# Altium project IMU Product.PrjPcb (part 1 of 2)
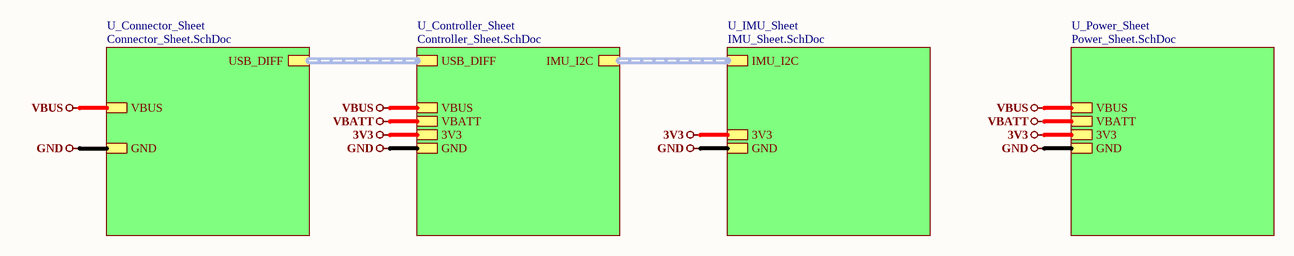
[diagram p0: Top-Sheet.SchDoc]
5 sheets, 58 parts. Net scope: hierarchical (ports join the sheet entries above them; power ports are global).
Board file: IMU Product.PcbDoc
Sheets:
  Top-Sheet.SchDoc
    U_Connector_Sheet = Connector_Sheet.SchDoc
    U_Controller_Sheet = Controller_Sheet.SchDoc
    U_IMU_Sheet = IMU_Sheet.SchDoc
    U_Power_Sheet = Power_Sheet.SchDoc

## Sheet Top-Sheet.SchDoc
size A4; SheetNumber: 1; SheetTotal: 5

### Sub-sheets
U_Connector_Sheet = Connector_Sheet.SchDoc: USB_DIFF (harness USB_DIFF), VBUS, GND
U_Controller_Sheet = Controller_Sheet.SchDoc: USB_DIFF (harness USB_DIFF), IMU_I2C (harness IMU_I2C), VBUS, VBATT, 3V3, GND
U_IMU_Sheet = IMU_Sheet.SchDoc: IMU_I2C (harness IMU_I2C), 3V3, GND
U_Power_Sheet = Power_Sheet.SchDoc: VBUS, VBATT, 3V3, GND

### Nets
3V3: sheet U_Controller_Sheet/3V3, sheet U_IMU_Sheet/3V3, sheet U_Power_Sheet/3V3
GND: sheet U_Connector_Sheet/GND, sheet U_Controller_Sheet/GND, sheet U_IMU_Sheet/GND, sheet U_Power_Sheet/GND
VBATT: sheet U_Controller_Sheet/VBATT, sheet U_Power_Sheet/VBATT
VBUS: sheet U_Connector_Sheet/VBUS, sheet U_Controller_Sheet/VBUS, sheet U_Power_Sheet/VBUS

### Buses and harness runs
harness sheet U_Connector_Sheet/USB_DIFF = sheet U_Controller_Sheet/USB_DIFF
harness sheet U_Controller_Sheet/IMU_I2C = sheet U_IMU_Sheet/IMU_I2C

### Notes on the sheet
- File:
- Title:
- Date:
- Page
- Num:
- Total:
- Drawn By: Huzaifa Ali

## Sheet Connector_Sheet.SchDoc
size A4; SheetNumber: 4; SheetTotal: 5
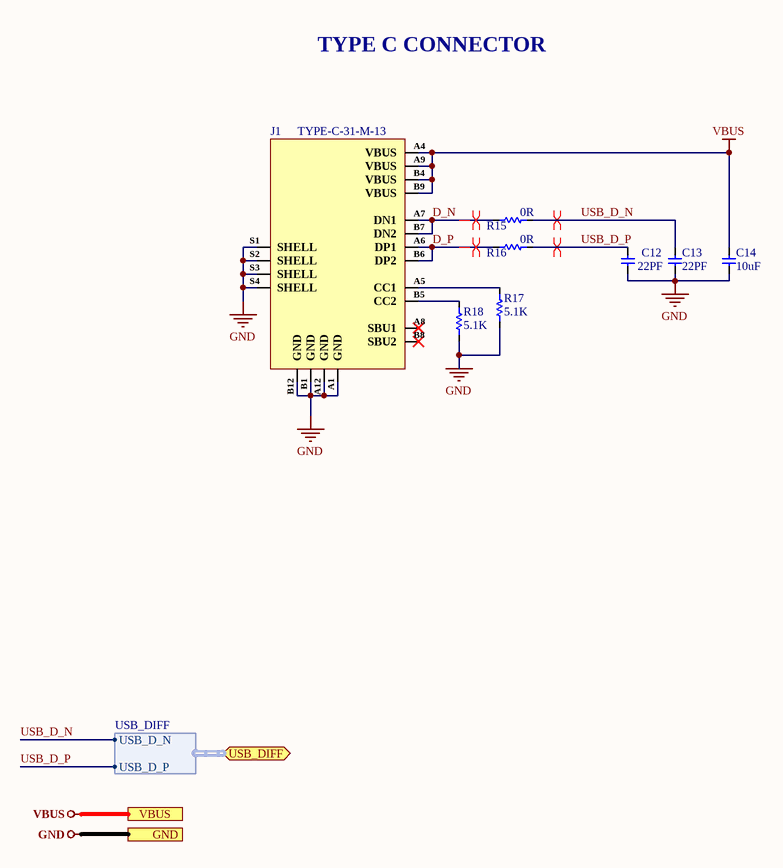
[diagram p1: Connector_Sheet.SchDoc]

### Parts
C12  22PF  [Cap-0402]
C13  22PF  [Cap-0402]
C14  10uF  [Cap-0402]
J1  TYPE-C-31-M-13  [TYPE-C-31-M-13]
R15  0R  [Res-0402]
R16  0R  [Res-0402]
R17  5.1K  [Res-0402]
R18  5.1K  [Res-0402]

### Ports
GND, USB_DIFF (bidir, harness USB_DIFF), VBUS

### Harnesses
USB_DIFF: USB_D_N, USB_D_P

### Nets
GND: C12.1 C13.1 C14.1 J1.A1(GND) J1.A12(GND) J1.B1(GND) J1.B12(GND) J1.S1(SHELL) J1.S2(SHELL) J1.S3(SHELL) J1.S4(SHELL) R17.1 R18.1 ; port GND
VBUS: C14.2 J1.A4(VBUS) J1.A9(VBUS) J1.B4(VBUS) J1.B9(VBUS) ; port VBUS
D_N: J1.A7(DN1) J1.B7(DN2) R15.1
D_P: J1.A6(DP1) J1.B6(DP2) R16.1
USB_D_N: C13.2 R15.2 ; port USB_DIFF.USB_D_N
USB_D_P: C12.2 R16.2 ; port USB_DIFF.USB_D_P
NetJ1_A5: J1.A5(CC1) R17.2
NetJ1_B5: J1.B5(CC2) R18.2

Not connected (* = marked no-connect by the designer): J1 A8(SBU1)* B8(SBU2)*

### Layout directives
differential pair; net class USB_PROGRAM; differential pair class USB_PROGRAM_LINES; rule Impedance Constraint [Min = 85.00    Max = 90.00    ]; rule Matched Net Lengths [Tolerance = 50mil]: D_N, D_P, USB_D_N, USB_D_P

### Notes on the sheet
- TYPE C CONNECTOR
- File:
- Title:
- Date:
- Page
- Num:
- Total:
- Drawn By: Huzaifa Ali

### Library data of the parts
C12 C13 = CC0402JRNPO9BN220: CAP CER 22PF 50V C0G/NPO 0402; Manufacturer: Yageo; Dielectric Material: Ceramic; Tolerance: 5%; Dielectric: C0G; Temperature Coefficient: 30ppm/°C; Insulation Resistance: 100GR; Item Type: Capacitor; Supplier 1: Future Electronics; Manufacturer Part Number: CC0402JRNPO9BN220; RoHS: Yes; Category: Ceramic Capacitors; Stock 1: 200000; Pricing 1: 10000=0.00220, 40000=0.00210, 150000=0.00200, 400000=0.00190, 1000000=0.00180 (USD); Mounting Technology: Surface Mount; Case/Package: 0402; Pins: 2; Case Code (Metric): 1005; Case Code (Imperial): 0402; Min Operating Temperature: -55°C; Max Operating Temperature: 125°C; Value: 22pF; Voltage Rating: 50V; Packaging: Tape and Reel; Package Quantity: 1; Voltage Rating (DC): 50V; Termination: SMD/SMT; Resistor Type: Ceramic; Voltage: 50V; Series: CC; Length: 1mm; Width: 0.02inch; Height: 0.5mm; Thickness: 0.022inch; Depth: 0.5mm; Radiation Hardening: No; Reach SVHC Compliant: Yes; Lead Free: Lead Free; RoHS Compliant: Yes; ComponentLink1URL: https://datasheet.ciiva.com/5789/1443161-5789509.pdf?src-supplier=Farnell; ComponentLink1Description: https://datasheet.ciiva.com/5789/1443161-5789509.pdf?src-supplier=Farnell; ComponentLink2URL: https://datasheet.ciiva.com/8033/1443161-8033606.pdf?src-supplier=Element14; ComponentLink2Description: https://datasheet.ciiva.com/8033/1443161-8033606.pdf?src-supplier=Element14; ComponentLink3URL: https://datasheet.ciiva.com/7656/1132289-7656615.pdf?src-supplier=Element14; ComponentLink3Description: https://datasheet.ciiva.com/7656/1132289-7656615.pdf?src-supplier=Element14; ComponentLink4URL: https://datasheet.ciiva.com/8033/1443161-8033607.pdf?src-supplier=Element14; ComponentLink4Description: https://datasheet.ciiva.com/8033/1443161-8033607.pdf?src-supplier=Element14; ComponentLink5URL: https://datasheet.ciiva.com/8033/1443161-8033605.pdf?src-supplier=Element14; ComponentLink5Description: https://datasheet.ciiva.com/8033/1443161-8033605.pdf?src-supplier=Element14; ComponentLink6URL: https://datasheet.ciiva.com/143/mlccorderingcode-143987.pdf?src-supplier=Digi-Key; ComponentLink6Description: https://datasheet.ciiva.com/143/mlccorderingcode-143987.pdf?src-supplier=Digi-Key; ComponentLink7URL: https://datasheet.ciiva.com/143/mlccorderingcode-143986.pdf?src-supplier=Digi-Key; ComponentLink7Description: https://datasheet.ciiva.com/143/mlccorderingcode-143986.pdf?src-supplier=Digi-Key; ComponentLink8URL: https://datasheet.ciiva.com/143/mlccorderingcode-143988.pdf?src-supplier=Digi-Key; ComponentLink8Description: https://datasheet.ciiva.com/143/mlccorderingcode-143988.pdf?src-supplier=Digi-Key; ComponentLink9URL: https://datasheet.ciiva.com/5425/upy-gp-np0-16v-to-50v-8-5425483.pdf?src-supplier=Mouser; ComponentLink9Description: https://datasheet.ciiva.com/5425/upy-gp-np0-16v-to-50v-8-5425483.pdf?src-supplier=Mouser; ComponentLink10URL: https://datasheet.ciiva.com/15189/getdatasheetpartid-370074-15189117.pdf?src-supplier=Verical; ComponentLink10Description: https://datasheet.ciiva.com/15189/getdatasheetpartid-370074-15189117.pdf?src-supplier=Verical; Supplier Part Number 1: 9105957; LCSC Part Number: C106203
C14 = CL05A106MP5NUNC: CAP CER 10UF 10V X5R 0402; Manufacturer: Samsung; Tolerance: 20%; Item Type: Capacitor; Supplier 1: Avnet; Manufacturer Part Number: CL05A106MP5NUNC; RoHS: Yes; Category: Ceramic Capacitors; Stock 1: 1729850; Pricing 1: 10000=0.02537 (USD); Mount: Surface Mount; Case/Package: 0402; Case Code (Metric): 1005; Case Code (Imperial): 0402; Contact Plating: Tin; Min Operating Temperature: -55°C; Max Operating Temperature: 85°C; Package Quantity: 1; Packaging: Tape and Reel; Capacitance: 10uF; Voltage Rating: 10V; Dielectric: X5R; Termination: Wraparound; Series: CL; Construction: Flat; Length: 1mm; Width: 0.02inch; Thickness: 0.028inch; Depth: 0.5mm; Radiation Hardening: No; Lead Free: Lead Free; RoHS Compliant: Yes; ComponentLink1URL: https://datasheet.ciiva.com/25721/cl05a106mp5nunc-25721584.pdf?src-supplier=Digi-Key; ComponentLink1Description: https://datasheet.ciiva.com/25721/cl05a106mp5nunc-25721584.pdf?src-supplier=Digi-Key; ComponentLink2URL: https://datasheet.ciiva.com/26838/getdatasheetpartid-745310-26838170.pdf?src-supplier=Verical; ComponentLink2Description: https://datasheet.ciiva.com/26838/getdatasheetpartid-745310-26838170.pdf?src-supplier=Verical; Supplier Part Number 1: CL05A106MP5NUNC; LCSC Part Number: C315248
J1 = TYPE-C-31-M-13: 1 12P Female Type-C SMD USB Connectors ROHS; Manufacturer: Korean Hroparts Elec; Item Type: USB Type-C  Connector; Manufacturer Part Number: TYPE-C-31-M-13; Package: SMD; LCSC Part Number: C223906; ComponentLink1Description: LCSC; ComponentLink1URL: https://www.lcsc.com/product-detail/USB-Connectors_Korean-Hroparts-Elec-TYPE-C-31-M-13_C223906.html?s_z=n_TYPE-C-31-M-13
R15 R16 = RCS04020000Z0ED: RES SMD 0 OHM JUMPER 1/5W 0402; Manufacturer: Vishay Dale; Resistance: 0mR; Max Power Dissipation: 200mW; Item Type: Resistor; Supplier 1: Digi-Key; Manufacturer Part Number: RCS04020000Z0ED; Stock 1: 35470; Pricing 1: 1=0.1, 10=0.083, 25=0.0576, 50=0.0448, 100=0.032, 250=0.02496, 500=0.01984, 1000=0.01408, 5000=0.01088 (USD); Case/Package: 0402; Case Code (Metric): 1005; Case Code (Imperial): 0402; Min Operating Temperature: -55°C; Max Operating Temperature: 155°C; Packaging: Tape and Reel; Resistor Type: Thick Film; Number of Terminations: 2; Features: Automotive AEC-Q200; Length: 0.039inch; Width: 0.02inch; Height: 0.016inch; RoHS Compliant: Yes; ComponentLink1URL: http://www.farnell.com/datasheets/2618474.pdf?src-supplier=Farnell; ComponentLink1Description: http://www.farnell.com/datasheets/2618474.pdf?src-supplier=Farnell; ComponentLink2URL: http://www.farnell.com/datasheets/2618474.pdf?src-supplier=Element14; ComponentLink2Description: http://www.farnell.com/datasheets/2618474.pdf?src-supplier=Element14; ComponentLink3URL: http://www.vishay.com/docs/20065/rcse3.pdf?src-supplier=Digi-Key; ComponentLink3Description: http://www.vishay.com/docs/20065/rcse3.pdf?src-supplier=Digi-Key; ComponentLink4URL: http://www.farnell.com/datasheets/2618474.pdf?src-supplier=Newark; ComponentLink4Description: http://www.farnell.com/datasheets/2618474.pdf?src-supplier=Newark; Supplier Part Number 1: 541-2877-1-ND; LCSC Part Number: C844673
R17 R18 = RC0402FR-075K1L: RES 5.1K OHM 1% 1/16W 0402; Manufacturer: Yageo; Power Rating: 63mW; Resistance: 5.1kR; Temperature Coefficient: 100ppm/°C; Voltage Rating: 50V; Item Type: Resistor; Supplier 1: Avnet; Manufacturer Part Number: RC0402FR-075K1L; RoHS: Yes; Category: Chip SMD Resistors; Stock 1: 65000; Pricing 1: 10000=0.00085 (USD); Case/Package: 0402; Case Code (Metric): 1005; Case Code (Imperial): 0402; Min Operating Temperature: -55°C; Max Operating Temperature: 155°C; Tolerance: 1%; Technology: THICK FILM; Packaging: Tape and Reel; Package Quantity: 1; Resistor Type: Thick Film; Number of Terminations: 2; Termination: SMD/SMT; Max Power Dissipation: 63mW; Voltage Rating (DC): 50V; Working Voltage: 50V; Features: Moisture Resistant; Series: RC; Resistance Tolerance: 1%; Construction: Rectangular; Length: 1mm; Width: 0.02inch; Height: 0.016inch; Depth: 0.5mm; RoHS Compliant: Yes; Military Standard: Not; Lead Free: Lead Free; ComponentLink1URL: https://datasheet.ciiva.com/7983/1018594-7983519.pdf?src-supplier=Element14; ComponentLink1Description: https://datasheet.ciiva.com/7983/1018594-7983519.pdf?src-supplier=Element14; ComponentLink2URL: https://datasheet.ciiva.com/46394/1018594-46394936.pdf?src-supplier=Element14; ComponentLink2Description: https://datasheet.ciiva.com/46394/1018594-46394936.pdf?src-supplier=Element14; ComponentLink3URL: https://datasheet.ciiva.com/2453/pyu-r-int-thick-7-2453401.pdf?src-supplier=Digi-Key; ComponentLink3Description: https://datasheet.ciiva.com/2453/pyu-r-int-thick-7-2453401.pdf?src-supplier=Digi-Key; ComponentLink4URL: https://datasheet.ciiva.com/2453/pyu-r-int-thick-7-2453402.pdf?src-supplier=Digi-Key; ComponentLink4Description: https://datasheet.ciiva.com/2453/pyu-r-int-thick-7-2453402.pdf?src-supplier=Digi-Key; ComponentLink5URL: https://datasheet.ciiva.com/2453/pyu-r-int-thick-7-2453400.pdf?src-supplier=Digi-Key; ComponentLink5Description: https://datasheet.ciiva.com/2453/pyu-r-int-thick-7-2453400.pdf?src-supplier=Digi-Key; ComponentLink6URL: https://datasheet.ciiva.com/12558/pyu-rc0402-51-rohs-l-6-r-8721-12558460.pdf?src-supplier=Mouser; ComponentLink6Description: https://datasheet.ciiva.com/12558/pyu-rc0402-51-rohs-l-6-r-8721-12558460.pdf?src-supplier=Mouser; ComponentLink7URL: https://datasheet.ciiva.com/16744/pyu-rc0402-51-rohs-l-6-r-16744283.pdf?src-supplier=Future+Electronics; ComponentLink7Description: https://datasheet.ciiva.com/16744/pyu-rc0402-51-rohs-l-6-r-16744283.pdf?src-supplier=Future+Electronics; ComponentLink8URL: https://datasheet.ciiva.com/15189/getdatasheetpartid-323636-15189493.pdf?src-supplier=Verical; ComponentLink8Description: https://datasheet.ciiva.com/15189/getdatasheetpartid-323636-15189493.pdf?src-supplier=Verical; Supplier Part Number 1: RC0402FR-075K1L; LCSC Part Number: C105872

## Sheet Controller_Sheet.SchDoc
size A4; SheetNumber: 3; SheetTotal: 5
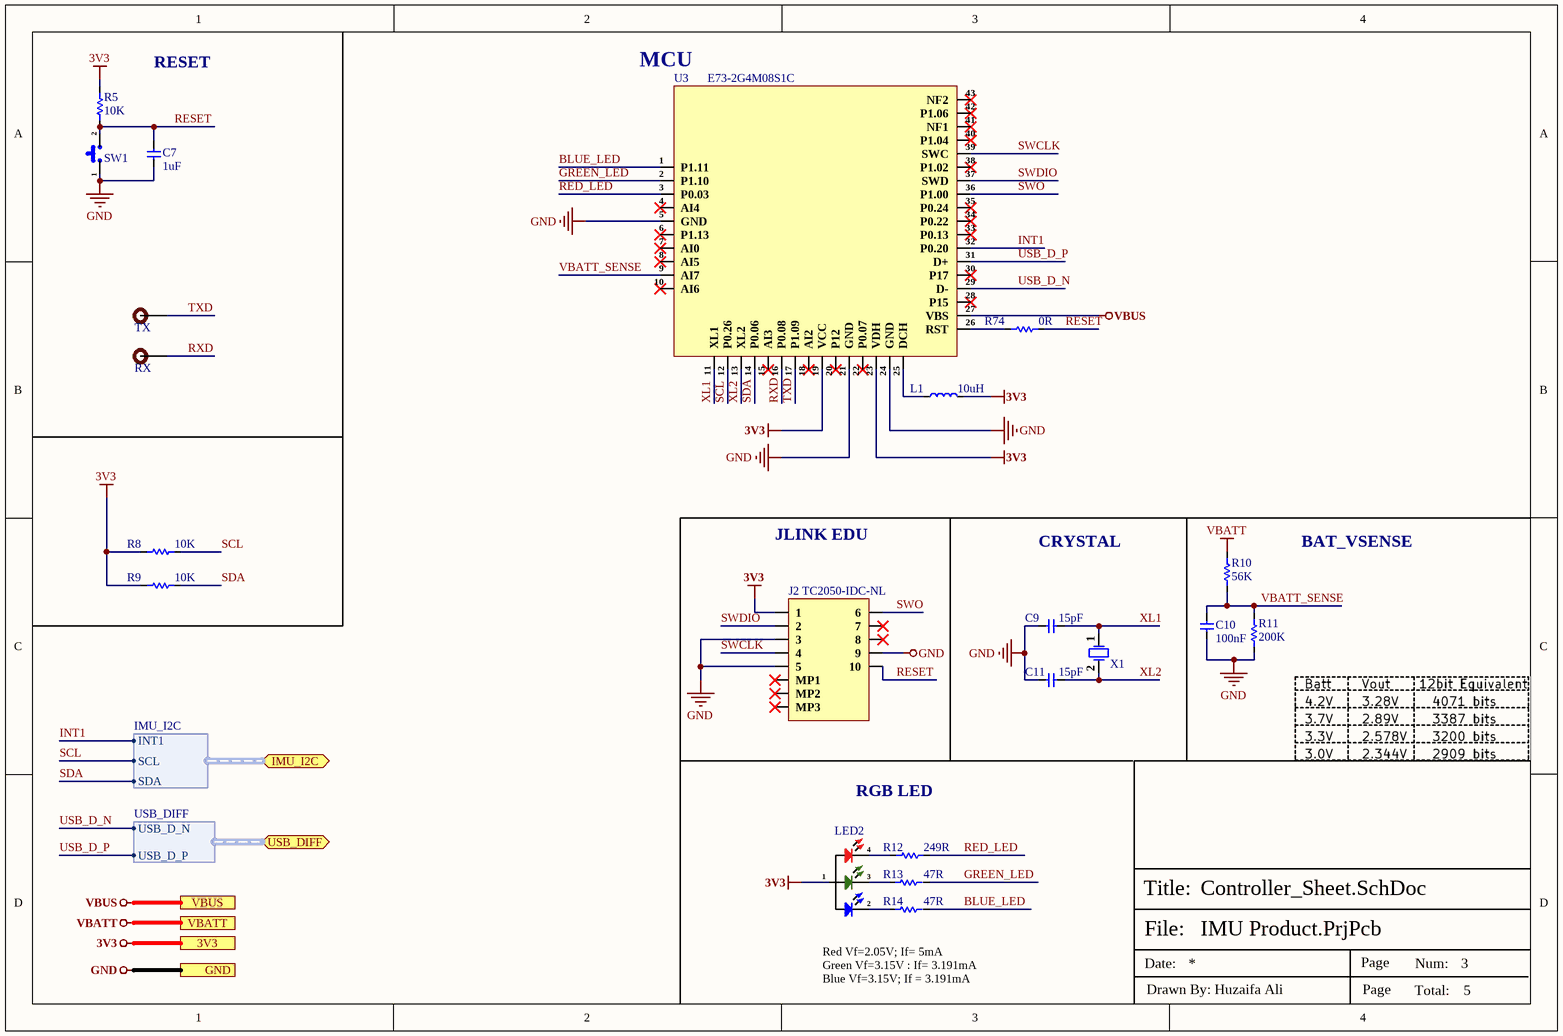
[diagram p2: Controller_Sheet.SchDoc]

### Parts
C7  1uF  [Cap-0402]
C9  15pF  [Cap-0402]
C10  100nF  [Cap-0402]
C11  15pF  [Cap-0402]
J2  TC2050-IDC-NL  [TC2050-IDC-NL_]
L1  10uH  [IND-0603 (1608 Metric)]
LED2  MHS110FRGBCT  [MHS110FRGBCT]  (value not drawn)
R5  10K  [Res-0402]
R8  10K  [Res-0402]
R9  10K  [Res-0402]
R10  56K  [Res-0402]
R11  200K  [Res-0402]
R12  249R  [Res-0402]
R13  47R  [Res-0402]
R14  47R  [Res-0402]
R74  0R  [Res-0402]
RX  TEST POINT 0.5mm Dia  [Test-point - 0.5mm]  (value not drawn)  (no BOM)
SW1  TS-1088-AR02016  [TS-1088-AR02016]  (value not drawn)
TX  TEST POINT 0.5mm Dia  [Test-point - 0.5mm]  (value not drawn)  (no BOM)
U3  E73-2G4M08S1C  [E73-2G4M08S1C]
X1  Q13FC13500004  [SMD3215-2P]  (value not drawn)

### Ports
3V3, GND, IMU_I2C (bidir, harness IMU_I2C), USB_DIFF (bidir, harness USB_DIFF), VBATT, VBUS

### Harnesses
USB_DIFF: USB_D_N, USB_D_P
IMU_I2C: INT1, SCL, SDA

### Nets
3V3: J2.1 L1.2 LED2.1(+) R5.2 R8.2 R9.2 U3.19(VCC) U3.23(VDH) ; port 3V3
GND: C7.1 C9.1 C10.1 C11.1 J2.3 J2.5 J2.9 R11.1 SW1.1 U3.5(GND) U3.21(GND) U3.24(GND) ; port GND
VBATT: R10.2 ; port VBATT
VBUS: U3.27(VBS) ; port VBUS
BLUE_LED: R14.2 U3.1(P1.11)
GREEN_LED: R13.2 U3.2(P1.10)
INT1: U3.32(P0.20) ; port IMU_I2C.INT1
RED_LED: R12.2 U3.3(P0.03)
RESET: C7.2 J2.10 R5.1 R74.2 SW1.2
RXD: RX.1 U3.16(P0.08)
SCL: R8.1 U3.12(P0.26) ; port IMU_I2C.SCL
SDA: R9.1 U3.14(P0.06) ; port IMU_I2C.SDA
SWCLK: J2.4 U3.39(SWC)
SWDIO: J2.2 U3.37(SWD)
SWO: J2.6 U3.36(P1.00)
TXD: TX.1 U3.17(P1.09)
USB_D_N: U3.29(D-) ; port USB_DIFF.USB_D_N
USB_D_P: U3.31(D+) ; port USB_DIFF.USB_D_P
VBATT_SENSE: C10.2 R10.1 R11.2 U3.9(AI7)
XL1: C9.2 U3.11(XL1) X1.1(OSC1)
XL2: C11.2 U3.13(XL2) X1.2(OSC2)
NetL1_1: L1.1 U3.25(DCH)
NetLED2_2: LED2.2(-BLUE) R14.1
NetLED2_3: LED2.3(-GREEN) R13.1
NetLED2_4: LED2.4(-RED) R12.1
NetR74_1: R74.1 U3.26(RST)

Not connected (* = marked no-connect by the designer): J2 7* 8* MP1* MP2* MP3*; U3 4(AI4)* 6(P1.13)* 7(AI0)* 8(AI5)* 10(AI6)* 15(AI3)* 18(AI2)* 20(P12)* 22(P0.07)* 28(P15)* 30(P17)* 33(P0.13)* 34(P0.22)* 35(P0.24)* 38(P1.02)* 40(P1.04)* 41(NF1)* 42(P1.06)* 43(NF2)*

### Notes on the sheet
- RESET
- (near U3) MCU
- JLINK EDU
- CRYSTAL
- BAT_VSENSE
- RGB LED
- Red Vf=2.05V; If= 5mA
  Green Vf=3.15V : If= 3.191mA
  Blue Vf=3.15V; If = 3.191mA
- File:
- Title:
- Date:
- Page
- Num:
- Total:
- Drawn By: Huzaifa Ali

### Library data of the parts
C7 = GRM155C71C105KE11D: CAP CER 1UF 16V X7S 0402; Manufacturer: Murata; Item Type: Capacitors; Material: 4241ConductorMaterial; Tolerance: 10%; Dielectric: 1542DielectricType; Supplier: Mouser; LCSC Part Number: C576449; Manufacturer Part Number: GRM155C71C105KE11D; RoHS: No; Stock: 16102; Pricing: 1=0.11, 10=0.041, 50=0.041, 100=0.026, 1000=0.023, 10000=0.016 (USD); Case/Package: 343Case; Min Operating Temperature: -55°C; Max Operating Temperature: 125°C; Value: 1uF; Voltage Rating: 16V; Voltage Rating (DC): 16V; Length: 1mm; Width: 500um; Height: 600um; Thickness: 500um
C9 C11 = CQ0402GRNPO9BN150: CAP CER 15PF 50V C0G/NPO 0402; Manufacturer: Yageo; Item Type: Capacitors; Tolerance: 2%; Dielectric: C0G; Supplier: Digikey; LCSC Part Number: C577406; Manufacturer Part Number: CQ0402GRNPO9BN150; RoHS: Yes; Pricing: 10000=0.04366 (USD); Mounting Technology: Surface Mount; Case/Package: 0402; Case Code (Imperial): 0402; Case Code (Metric): 1005; Weight: 2.3E-05oz; Min Operating Temperature: -55°C; Max Operating Temperature: 125°C; Value: 15pF; Packaging: Tape and Reel; Voltage Rating: 50V; Voltage Rating (DC): 50V; Package Quantity: 10000; Series: CQ; ComponentLink1URL: http://www.mouser.com/ds/2/447/UPY-High%20Q_NP0_16V-to-250V_11-533944.pdf?src-supplier=Mouser; ComponentLink1Description: http://www.mouser.com/ds/2/447/UPY-High%20Q_NP0_16V-to-250V_11-533944.pdf?src-supplier=Mouser; ComponentLink2URL: http://www.yageo.com/documents/recent/UPY-High%20Q_NP0_16V-to-250V_13.pdf?src-supplier=Digikey; ComponentLink2Description: http://www.yageo.com/documents/recent/UPY-High%20Q_NP0_16V-to-250V_13.pdf?src-supplier=Digikey
C10 = CC0402KRX5R8BB104: CAP CER 0.1UF 25V X5R 0402; Manufacturer: Yageo; Tolerance: 10%; Item Type: Capacitor; Supplier 1: Digi-Key; Manufacturer Part Number: CC0402KRX5R8BB104; RoHS: Yes; Category: Ceramic Capacitors; Stock 1: 4598218; Pricing 1: 1=0.10000, 10=0.03800, 50=0.02100, 100=0.01710, 500=0.01224, 1000=0.00961, 2500=0.00874, 5000=0.00804 (USD); Mount: Surface Mount; Case/Package: 0402; Case Code (Metric): 1005; Case Code (Imperial): 0402; Min Operating Temperature: -55°C; Max Operating Temperature: 85°C; Voltage Rating: 25V; Packaging: Tape and Reel; Capacitance: 100nF; Voltage Rating (DC): 25V; Dielectric: X5R; Resistor Type: Ceramic; Series: CC; Length: 0.039inch; Width: 0.02inch; Thickness: 0.022inch; Depth: 0.5mm; Lead Free: Lead Free; Halogen Free: Halogen Free; RoHS Compliant: Yes; ComponentLink1URL: http://www.mouser.com/ds/2/447/UPY-GPHC_X5R_4V-to-50V_25-1131599.pdf?src-supplier=Mouser; ComponentLink1Description: http://www.mouser.com/ds/2/447/UPY-GPHC_X5R_4V-to-50V_25-1131599.pdf?src-supplier=Mouser; ComponentLink2URL: http://www.yageo.com/documents/recent/UPY-GPHC_X5R_4V-to-50V-16.pdf?src-supplier=Future+Electronics; ComponentLink2Description: http://www.yageo.com/documents/recent/UPY-GPHC_X5R_4V-to-50V-16.pdf?src-supplier=Future+Electronics; ComponentLink3URL: http://www.yageo.com/documents/recent/UPY-GPHC_X5R_4V-to-50V_25.pdf?src-supplier=Digi-Key; ComponentLink3Description: http://www.yageo.com/documents/recent/UPY-GPHC_X5R_4V-to-50V_25.pdf?src-supplier=Digi-Key; Supplier Part Number 1: 311-1697-1-ND; LCSC Part Number: C106256
J2 = TC2050-IDC-NL: CBL PLUG-OF-NAILS 10-PIN; Manufacturer: Tag-Connect; Supplier 1: Digi-Key; Manufacturer Part Number: TC2050-IDC-NL; Stock 1: 544; Pricing 1: 1=40.17 (USD); Package Quantity: 1; ComponentLink1URL: http://www.tag-connect.com/Materials/TC2050-IDC-NL%20Datasheet.pdf?src-supplier=Digi-Key; ComponentLink1Description: http://www.tag-connect.com/Materials/TC2050-IDC-NL%20Datasheet.pdf?src-supplier=Digi-Key; Supplier Part Number 1: TC2050-IDC-NL-ND
L1 = LBMF1608T100K: FIXED IND 10UH 80MA 360 MOHM SMD; Manufacturer: Taiyo Yuden; Item Type: Inductors; Core Material: Ferrite; Self Resonant Frequency: 32MHz; Tolerance: 10%; Shielding: Unshielded; Test Frequency: 2.52MHz; DC Resistance (DCR): 360mR; ESR: 468mR; Supplier: Digikey; LCSC Part Number: C87216; Manufacturer Part Number: LBMF1608T100K; RoHS: Yes; Stock: 2726337; Pricing: 1=0.13, 10=0.103, 25=0.0936, 50=0.0866, 100=0.0802, 250=0.07256, 500=0.06724, 1000=0.0623 (USD); Mounting Technology: Surface Mount; Case/Package: 0603; Weight: 7.1E-05oz; Case Code (Metric): 1608; Case Code (Imperial): 0603; Min Operating Temperature: -40°C; Max Operating Temperature: 105°C; Packaging: Tape and Reel; Value: 10uH; Max DC Current: 80mA; Termination: SMD/SMT; Inductance Tolerance: 10%; DC Current: 80mA; Series: LB, MF Type; RMS Current (Irms): 80mA; Length: 1.6mm; Width: 0.8mm; Height: 0.35mm; Lead Pitch: 0.7mm; Depth: 0.9mm; Radiation Hardening: No; Military Standard: Not; RoHS Compliant: Yes; Reach SVHC Compliant: Unknown; ComponentLink1URL: https://datasheet.ciiva.com/26872/getdatasheetpartid-637440-26872437.pdf?src-supplier=Verical; ComponentLink1Description: https://datasheet.ciiva.com/26872/getdatasheetpartid-637440-26872437.pdf?src-supplier=Verical; ComponentLink2URL: https://datasheet.ciiva.com/15986/610lbmf1608t100k-15986589.pdf?src-supplier=Onlinecomponents.com; ComponentLink2Description: https://datasheet.ciiva.com/15986/610lbmf1608t100k-15986589.pdf?src-supplier=Onlinecomponents.com; ComponentLink3URL: https://datasheet.ciiva.com/1040/lbmf1608t100k-ss-1040360.pdf?src-supplier=Digikey; ComponentLink3Description: https://datasheet.ciiva.com/1040/lbmf1608t100k-ss-1040360.pdf?src-supplier=Digikey; ComponentLink4URL: https://datasheet.ciiva.com/8504/lbmf1608t100k-ss-8504740.pdf?src-supplier=Avnet; ComponentLink4Description: https://datasheet.ciiva.com/8504/lbmf1608t100k-ss-8504740.pdf?src-supplier=Avnet; ComponentLink5URL: https://datasheet.ciiva.com/46395/1497259-46395174.pdf?src-supplier=Element14; ComponentLink5Description: https://datasheet.ciiva.com/46395/1497259-46395174.pdf?src-supplier=Element14
LED2 = MHS110FRGBCT: Colorless transparence Side stickers -40℃~+85℃ Common anode RGB 120° 60mW SMD,1.5x3.2mm Light Emitting Diodes (LED) ROHS; Manufacturer: MEIHUA; Item Type: RGB LED; Manufacturer Part Number: MHS110FRGBCT; Package: SMD,1.5x3.2mm; LCSC Part Number: C496820; ComponentLink1Description: LCSC; ComponentLink1URL: https://www.lcsc.com/product-detail/Light-Emitting-Diodes-LED_MEIHUA-MHS110FRGBCT_C496820.html
R5 R8 R9 = RE0402DRE0710KL: RES SMD 10K OHM 0.5% 1/16W 0402; Manufacturer: Yageo; Value: 10kR; Max Power Dissipation: 63mW; Temperature Coefficient: 50ppm/°C; Item Type: Resistor; Supplier: Future Electronics; Supplier Part Number: 8132697; Manufacturer Part Number: RE0402DRE0710KL; RoHS: Yes; Category: Chip SMD Resistors; Stock: 10000; Pricing: 10000=0.0059, 40000=0.0056, 150000=0.0053, 250000=0.0052, 500000=0.0049 (USD); Case/Package: 0402; Min Operating Temperature: -55°C; Max Operating Temperature: 155°C; Packaging: Tape and Reel; Number of Terminations: 2; Tolerance: 0.5%; Features: Moisture Resistant; Series: RE; Length: 0.039inch; Width: 0.02inch; Height: 0.015inch; RoHS Compliant: Yes; ComponentLink1URL: http://www.yageo.com/NewPortal/yageodocoutput?fileName=/pdf/R-Chip/PYu-RE_105_RoHS_L_6.pdf&src-supplier=Digi-Key; ComponentLink1Description: http://www.yageo.com/NewPortal/yageodocoutput?fileName=/pdf/R-Chip/PYu-RE_105_RoHS_L_6.pdf&src-supplier=Digi-Key; LCSC Part Number: C851874
R10 = RT0402BRD0756KL: RES SMD 56K OHM 0.1% 1/16W 0402; Manufacturer: Yageo; Item Type: Resistors; Supplier: Arrow Electronics; LCSC Part Number: C852845; Manufacturer Part Number: RT0402BRD0756KL; RoHS: Yes; Stock: 70000; Pricing: 10000=0.0279 (USD); ComponentLink1URL: https://datasheet.ciiva.com/12721/pyu-rt-1-to-0-05-rohs-l-4-12721243.pdf?src-supplier=Mouser; ComponentLink1Description: https://datasheet.ciiva.com/12721/pyu-rt-1-to-0-05-rohs-l-4-12721243.pdf?src-supplier=Mouser; ComponentLink2URL: https://datasheet.ciiva.com/2582/pyu-rt-1-to-0-05-rohs-l-4-2582430.pdf?src-supplier=Digikey; ComponentLink2Description: https://datasheet.ciiva.com/2582/pyu-rt-1-to-0-05-rohs-l-4-2582430.pdf?src-supplier=Digikey
R11 = RC0402DR-07200KL: RES 200K OHM 0.5% 1/16W 0402; Manufacturer: Yageo; Resistance: 200kR; Max Power Dissipation: 63mW; Temperature Coefficient: 100ppm/°C; Supplier 1: Mouser; Manufacturer Part Number: RC0402DR-07200KL; RoHS: Yes; Category: Chip SMD Resistors; Pricing 1: 1=0.13000, 10=0.07000, 50=0.07000, 100=0.02900, 1000=0.01300, 10000=0.00700 (USD); Case/Package: 0402; Min Operating Temperature: -55°C; Max Operating Temperature: 155°C; Packaging: Tape and Reel; Resistor Type: Thick Film; Number of Terminations: 2; Tolerance: 0.5%; Features: Moisture Resistant; Length: 0.039inch; Width: 0.02inch; Height: 0.016inch; ComponentLink1URL: http://www.yageo.com.tw/exep/pages/download/literatures/PYu-R_INT-thick_7.pdf?src-supplier=Digi-Key; ComponentLink1Description: http://www.yageo.com.tw/exep/pages/download/literatures/PYu-R_INT-thick_7.pdf?src-supplier=Digi-Key; Supplier Part Number 1: 603-RC0402DR-07200KL; LCSC Part Number: C138077
R12 = RT0402BRD07249RL: RES SMD 249 OHM 0.1% 1/16W 0402; Manufacturer: Yageo; Item Type: Resistor; Supplier: Arrow Electronics; Supplier Part Number: RT0402BRD07249RL; Manufacturer Part Number: RT0402BRD07249RL; RoHS: Yes; Category: Chip SMD Resistors; Stock: 6437; Pricing: 1=0.2065, 10=0.1009, 25=0.1005, 100=0.0454, 250=0.045, 500=0.043, 1000=0.026, 3000=0.0241, 6000=0.0223 (USD); ComponentLink1URL: https://datasheet.ciiva.com/2582/pyu-rt-1-to-0-05-rohs-l-5-2582249.pdf?src-supplier=Digi-Key; ComponentLink1Description: https://datasheet.ciiva.com/2582/pyu-rt-1-to-0-05-rohs-l-5-2582249.pdf?src-supplier=Digi-Key; LCSC Part Number: C852662
R13 R14 = RC0402FR-0747RL: RES 47 OHM 1% 1/16W 0402; Manufacturer: Yageo; Temperature Coefficient: 100ppm/°C; Power Rating: 63mW; Voltage Rating: 50V; Item Type: Resistor; Supplier 1: Avnet; Manufacturer Part Number: RC0402FR-0747RL; RoHS: Yes; Category: Chip SMD Resistors; Stock 1: 390000; Pricing 1: 10000=0.00085 (USD); Case/Package: 0402; Case Code (Metric): 1005; Case Code (Imperial): 0402; Weight: 2.3E-05oz; Size Code: 0402; Min Operating Temperature: -55°C; Max Operating Temperature: 155°C; Resistance: 47R; Tolerance: 1%; Packaging: Tape and Reel; Resistor Type: Thick Film; Package Quantity: 1; Number of Terminations: 2; Termination: SMD/SMT; Max Power Dissipation: 63mW; Features: Moisture Resistant; Series: RC; Construction: Rectangular; Technology: THICK FILM; Resistance Tolerance: 1%; Length: 1mm; Width: 0.02inch; Height: 0.016inch; Depth: 0.5mm; Lead Free: Lead Free; Military Standard: Not; RoHS Compliant: Yes; Supplier Part Number 1: RC0402FR-0747RL; LCSC Part Number: C137973; ComponentLink1Description: LCSC; ComponentLink1URL: https://www.lcsc.com/product-detail/Chip-span-style-background-color-ff0-Resistor-span-Surface-Mount_YAGEO-RC0402FR-0747RL_C137973.html
R74 = RC0402FR-070RL: RES 0 OHM JUMPER 1/16W 0402; Manufacturer: Yageo; Item Type: Resistors; Tolerance: 1%; Power Rating: 62.5mW; Voltage Rating: 50V; Temperature Coefficient: 200ppm/°C; Max Power Dissipation: 63mW; Supplier 1: Mouser; Manufacturer Part Number: RC0402FR-070RL; RoHS: Yes; Stock 1: 8556842; Pricing 1: 1=0.10000, 10=0.01400, 50=0.01400, 100=0.00600, 1000=0.00300, 5000=0.00200, 10000=0.00100 (USD); Mount: Surface Mount; Case/Package: 0402; Contact Plating: Tin,Matte; Case Code (Imperial): 0402; Case Code (Metric): 1005; Size Code: 0402; Min Operating Temperature: -55°C; Max Operating Temperature: 155°C; Resistance: 0R; Resistor Type: Thick Film; Packaging: Tape and Reel; Termination: SMD/SMT; Features: Moisture Resistant; Series: RC; Number of Terminations: 2; Length: 1mm; Width: 0.5mm; Height: 0.35mm; Radiation Hardening: No; Lead Free: Lead Free; RoHS Compliant: Yes; ComponentLink1URL: https://datasheet.ciiva.com/8896/pyu-rc0402-51-rohs-l-6-8896149.pdf?src-supplier=Avnet; ComponentLink1Description: https://datasheet.ciiva.com/8896/pyu-rc0402-51-rohs-l-6-8896149.pdf?src-supplier=Avnet; ComponentLink2URL: https://datasheet.ciiva.com/16790/pyu-rc0402-51-rohs-l-6-r-16790444.pdf?src-supplier=Future+Electronics; ComponentLink2Description: https://datasheet.ciiva.com/16790/pyu-rc0402-51-rohs-l-6-r-16790444.pdf?src-supplier=Future+Electronics; Supplier Part Number 1: 603-RC0402FR-070RL; LCSC Part Number: C106231
RX TX = TEST POINT 0.5mm Dia: Test Point ON; Item Type: Test Point; Manufacturer Part Number: TEST POINT 0.5mm Dia
SW1 = TS-1088-AR02016: Without bracket 50mA 4mm 100000 Times 12V 160gf 3mm 2mm Round Button Standing paste SPST SMD Tactile Switches ROHS; Manufacturer: XUNPU; Manufacturer Part Number: TS-1088-AR02016; Package: SMD; LCSC Part Number: C720477; Item Type: Tactile Switch; ComponentLink1Description: LCSC; ComponentLink1URL: https://www.lcsc.com/product-detail/Tactile-Switches_XUNPU-TS-1088-AR02016_C720477.html?s_z=n_TS-1088-AR02016
U3 = E73-2G4M08S1C: Bluetooth Modules ROHS; Manufacturer: Chengdu Ebyte Elec Tech; Item Type: Module; Manufacturer Part Number: E73-2G4M08S1C; Package: Custom; LCSC Part Number: C356849; ComponentLink1Description: LCSC; ComponentLink1URL: https://www.lcsc.com/product-detail/Bluetooth-Modules_Chengdu-Ebyte-Elec-Tech-E73-2G4M08S1C_C356849.html?s_z=n_E73-2G4M08S1C
X1 = Q13FC13500004: 32.768kHz Surface Mount Crystal 12.5pF ±20ppm SMD3215-2P Crystals ROHS; Manufacturer: Epson; Supplier: Farnell; LCSC Part Number: C32346; Manufacturer Part Number: Q13FC13500004; RoHS: Yes; Item Type: Crystals; Stock: 52665; Reach SVHC Compliant: 4187SVHC; ComponentLink1URL: https://datasheet.octopart.com/Q13FC13500004-Epson-datasheet-62043850.pdf?src-supplier=Farnell; ComponentLink1Description: https://datasheet.octopart.com/Q13FC13500004-Epson-datasheet-62043850.pdf?src-supplier=Farnell; ComponentLink2URL: https://datasheet.octopart.com/Q13FC13500004-Epson-datasheet-32025749.pdf?src-supplier=Newark; ComponentLink2Description: https://datasheet.octopart.com/Q13FC13500004-Epson-datasheet-32025749.pdf?src-supplier=Newark

## Sheet IMU_Sheet.SchDoc
size A4; SheetNumber: 5; SheetTotal: 5
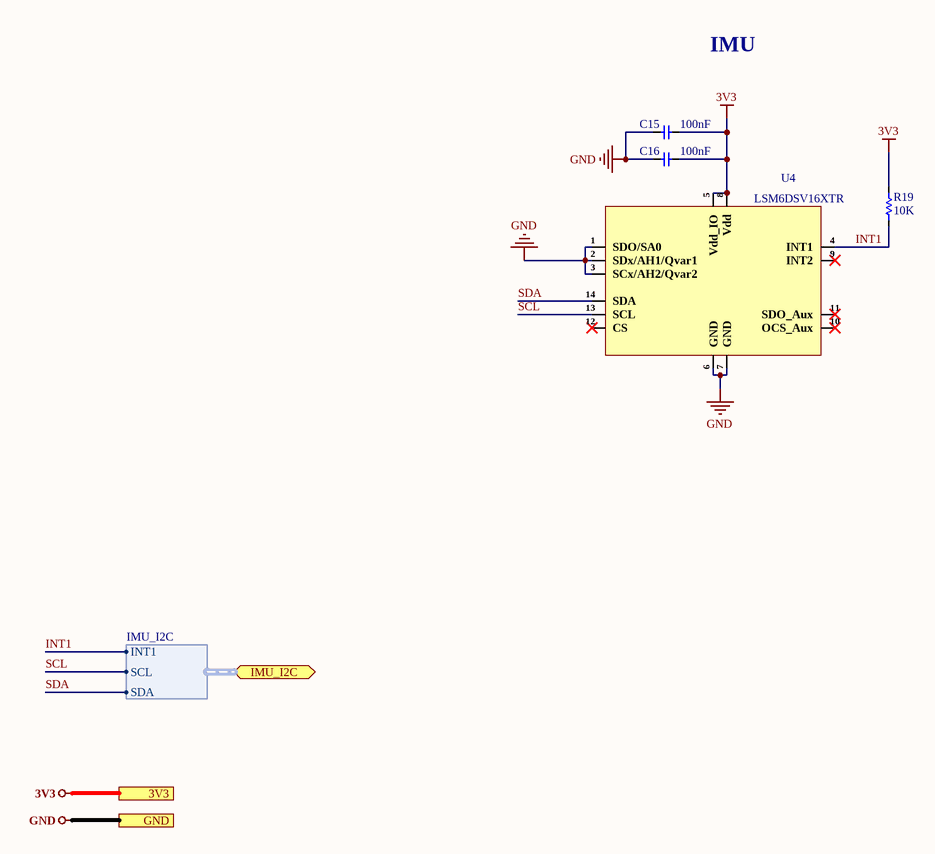
[diagram p3: IMU_Sheet.SchDoc]

### Parts
C15  100nF  [Cap-0402]
C16  100nF  [Cap-0402]
R19  10K  [Res-0402]
U4  LSM6DSV16XTR  [14-LGA (2.5x3)]

### Ports
3V3, GND, IMU_I2C (bidir, harness IMU_I2C)

### Harnesses
IMU_I2C: INT1, SCL, SDA

### Nets
3V3: C15.1 C16.1 R19.1 U4.5(Vdd_IO) U4.8(Vdd) ; port 3V3
GND: C15.2 C16.2 U4.1(SDO/SA0) U4.2(SDx/AH1/Qvar1) U4.3(SCx/AH2/Qvar2) U4.6(GND) U4.7(GND) ; port GND
INT1: R19.2 U4.4(INT1) ; port IMU_I2C.INT1
SCL: U4.13(SCL) ; port IMU_I2C.SCL
SDA: U4.14(SDA) ; port IMU_I2C.SDA

Not connected (* = marked no-connect by the designer): U4 9(INT2)* 10(OCS_Aux)* 11(SDO_Aux)* 12(CS)*

### Notes on the sheet
- IMU
- File:
- Title:
- Date:
- Page
- Num:
- Total:
- Drawn By: Huzaifa Ali

### Library data of the parts
C15 C16 = CC0402KRX5R8BB104: as C10 on sheet Controller_Sheet; Supplier 1: Digi-Key; Manufacturer Part Number: CC0402KRX5R8BB104; RoHS: Yes; Category: Ceramic Capacitors; Stock 1: 4598218; Pricing 1: 1=0.10000, 10=0.03800, 50=0.02100, 100=0.01710, 500=0.01224, 1000=0.00961, 2500=0.00874, 5000=0.00804 (USD); Mount: Surface Mount; Case/Package: 0402; Case Code (Metric): 1005; Case Code (Imperial): 0402; Min Operating Temperature: -55°C; Max Operating Temperature: 85°C; Voltage Rating: 25V; Packaging: Tape and Reel; Capacitance: 100nF; Voltage Rating (DC): 25V; Dielectric: X5R; Resistor Type: Ceramic; Series: CC; Length: 0.039inch; Width: 0.02inch; Thickness: 0.022inch; Depth: 0.5mm; Lead Free: Lead Free; Halogen Free: Halogen Free; RoHS Compliant: Yes; ComponentLink1URL: http://www.mouser.com/ds/2/447/UPY-GPHC_X5R_4V-to-50V_25-1131599.pdf?src-supplier=Mouser; ComponentLink1Description: http://www.mouser.com/ds/2/447/UPY-GPHC_X5R_4V-to-50V_25-1131599.pdf?src-supplier=Mouser; ComponentLink2URL: http://www.yageo.com/documents/recent/UPY-GPHC_X5R_4V-to-50V-16.pdf?src-supplier=Future+Electronics; ComponentLink2Description: http://www.yageo.com/documents/recent/UPY-GPHC_X5R_4V-to-50V-16.pdf?src-supplier=Future+Electronics; ComponentLink3URL: http://www.yageo.com/documents/recent/UPY-GPHC_X5R_4V-to-50V_25.pdf?src-supplier=Digi-Key; ComponentLink3Description: http://www.yageo.com/documents/recent/UPY-GPHC_X5R_4V-to-50V_25.pdf?src-supplier=Digi-Key; Supplier Part Number 1: 311-1697-1-ND; LCSC Part Number: C106256
R19 = RE0402DRE0710KL: as R5 on sheet Controller_Sheet; Supplier: Future Electronics; Supplier Part Number: 8132697; Manufacturer Part Number: RE0402DRE0710KL; RoHS: Yes; Category: Chip SMD Resistors; Stock: 10000; Pricing: 10000=0.0059, 40000=0.0056, 150000=0.0053, 250000=0.0052, 500000=0.0049 (USD); Case/Package: 0402; Min Operating Temperature: -55°C; Max Operating Temperature: 155°C; Packaging: Tape and Reel; Number of Terminations: 2; Tolerance: 0.5%; Features: Moisture Resistant; Series: RE; Length: 0.039inch; Width: 0.02inch; Height: 0.015inch; RoHS Compliant: Yes; ComponentLink1URL: http://www.yageo.com/NewPortal/yageodocoutput?fileName=/pdf/R-Chip/PYu-RE_105_RoHS_L_6.pdf&src-supplier=Digi-Key; ComponentLink1Description: http://www.yageo.com/NewPortal/yageodocoutput?fileName=/pdf/R-Chip/PYu-RE_105_RoHS_L_6.pdf&src-supplier=Digi-Key; LCSC Part Number: C851874
U4 = LSM6DSV16XTR: INEMO 3D ACCELEROMETER AND 3D GY; Manufacturer: STMicroelectronics; Item Type: IC; Max Supply Voltage: 3.6V; Min Supply Voltage: 1.71V; Supplier: Arrow Electronics; LCSC Part Number: C5267406; Manufacturer Part Number: LSM6DSV16XTR; RoHS: No; Stock: 5000; Pricing: 5000=2.815 (USD); Min Operating Temperature: -40°C; Max Operating Temperature: 85°C; Height: 860um